# Altium schematic sheet Connector_Sheet.SchDoc
size A4; DocumentNumber: 5; SheetNumber: 5; SheetTotal: 7
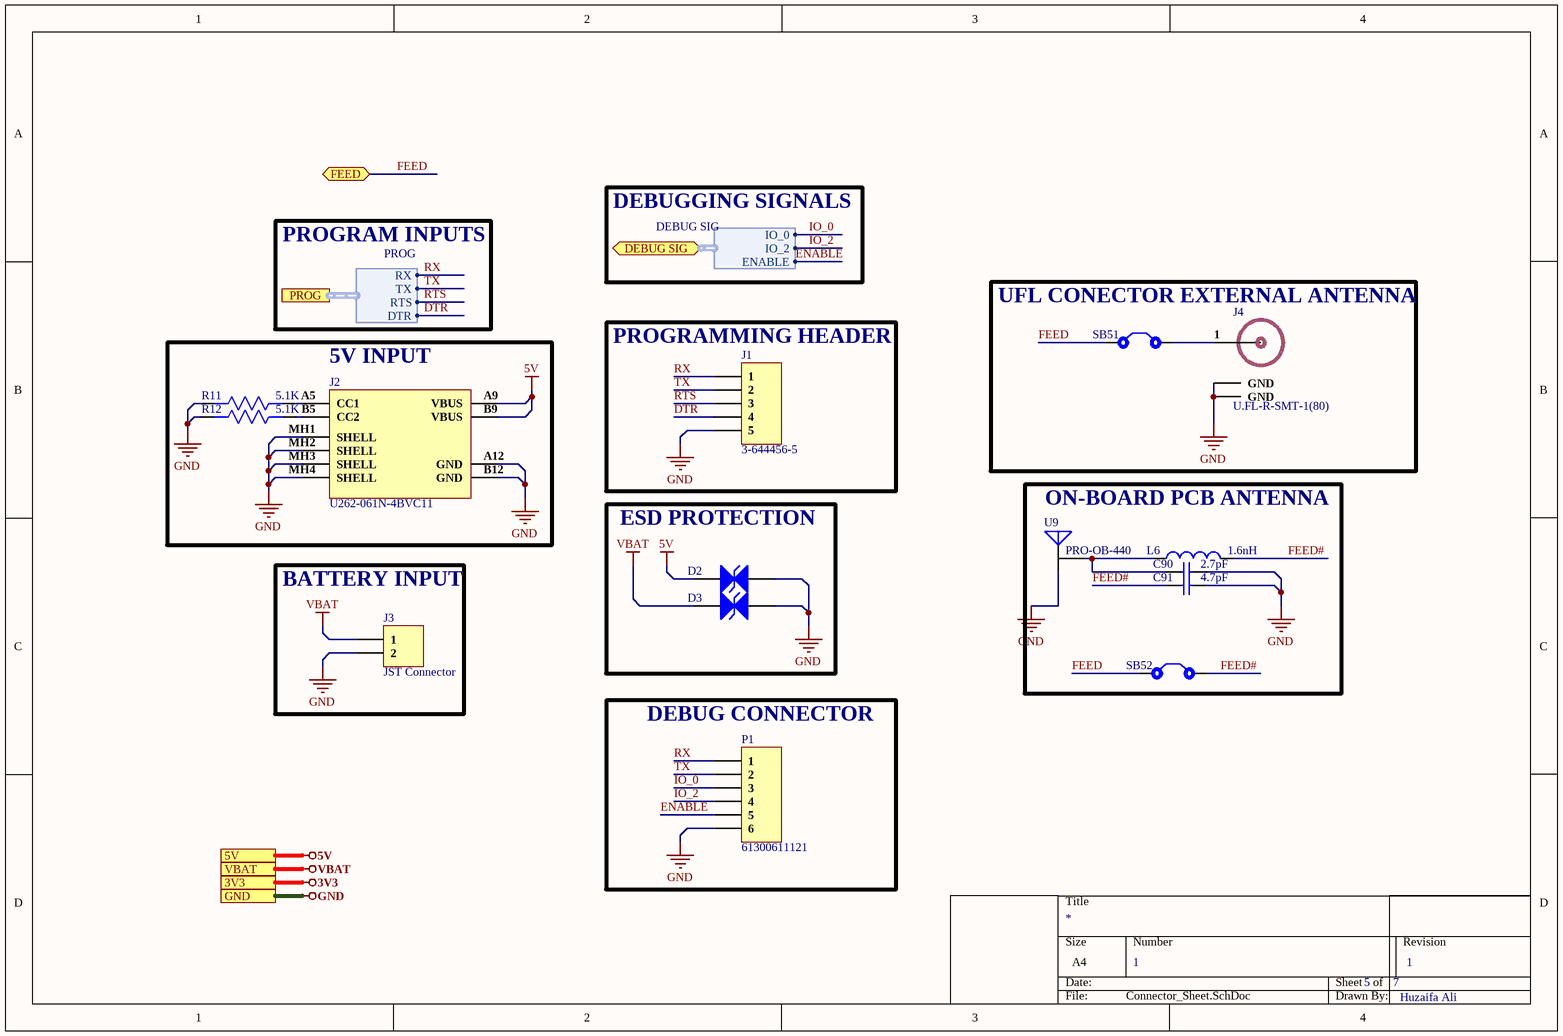
[diagram p0: Connector_Sheet.SchDoc]

## Parts
C90  2.7pF  [Cap 0603]
C91  4.7pF  [Cap 0603]
D2  TPD1E10B06DPYR  [X1SON - 0.45 mm max height]  (value not drawn)
D3  TPD1E10B06DPYR  [X1SON - 0.45 mm max height]  (value not drawn)
J1  3-644456-5  [HDR1X5]
J2  U262-061N-4BVC11  [U262-061N-4BVC11]
J3  JST Connector  [JST Connector]
J4  U.FL-R-SMT-1(80)  [U.FL-R-SMT-1(80)]
L6  1.6nH  [FHW0603UC1N6KST]
P1  61300611121  [HDR1X6]
R11  5.1K  [Res0603]
R12  5.1K  [Res0603]
SB51  Solder Bridge  [Solder Bridge]  (value not drawn)
SB52  Solder Bridge  [Solder Bridge]  (value not drawn)
U9  PRO-OB-440  [PRO-OB-440]

## Blocks framed on the sheet
UFL CONECTOR EXTERNAL ANTENNA: J4 SB51
5V INPUT: J2 R11 R12
PROGRAMMING HEADER: J1
ESD PROTECTION: D2 D3
ON-BOARD PCB ANTENNA: C90 C91 L6 SB52 U9
BATTERY INPUT: J3
DEBUG CONNECTOR: P1

## Ports
3V3, 5V, DEBUG SIG (bidir, harness DEBUG SIG), FEED (bidir), GND, PROG (harness PROG), VBAT

## Harnesses
PROG: RX, TX, RTS, DTR
DEBUG SIG: IO_0, IO_2, ENABLE

## Nets
3V3: port 3V3
5V: D2.2 J2.A9(VBUS) J2.B9(VBUS) ; port 5V
GND: C90.2 C91.2 D2.1 D3.1 J1.5 J2.A12(GND) J2.B12(GND) J2.MH1(SHELL) J2.MH2(SHELL) J2.MH3(SHELL) J2.MH4(SHELL) J3.2 J4.2(GND) J4.3(GND) P1.6 R11.2 R12.2 U9.1(A) ; port GND
VBAT: D3.2 J3.1 ; port VBAT
DTR: J1.4 ; port PROG.DTR
ENABLE: P1.5 ; port DEBUG SIG.ENABLE
FEED: SB51.1 SB52.1 ; port FEED
FEED#: C91.1 L6.2 SB52.2
IO_0: P1.3 ; port DEBUG SIG.IO_0
IO_2: P1.4 ; port DEBUG SIG.IO_2
RTS: J1.3 ; port PROG.RTS
RX: J1.1 P1.1 ; port PROG.RX
TX: J1.2 P1.2 ; port PROG.TX
NetC90_1: C90.1 L6.1 U9.2(A)
NetJ2_A5: J2.A5(CC1) R11.1
NetJ2_B5: J2.B5(CC2) R12.1
NetJ4_1: J4.1(RF_IN) SB51.2

Not connected (* = marked no-connect by the designer): U9 3(A) 4(A)

## Notes on the sheet
- PROGRAM INPUTS
- DEBUGGING SIGNALS
- 1
- Huzaifa Ali

## Library data of the parts
C90 = CC0603CRNPO9BN2R7: CAP SMD  2.7pF ±0.25pF 50V NPO 0603; Manufacturer: Yageo; Dielectric: C0G; Insulation Resistance: 10GR; Supplier 1: Newark; Manufacturer Part Number: CC0603CRNPO9BN2R7; RoHS: Yes; Category: Ceramic Capacitors; Stock 1: 2084; Pricing 1: 1=0.10000, 10=0.05800, 25=0.04700, 50=0.03700, 100=0.02600 (USD); Mount: Surface Mount; Case/Package: 0603; Case Code (Imperial): 0603; Case Code (Metric): 1608; Weight: 7.1E-05oz; Min Operating Temperature: -55°C; Max Operating Temperature: 125°C; Capacitance: 2.7pF; Packaging: Tape and Reel; Voltage Rating: 50V; Voltage Rating (DC): 50V; Termination: SMD/SMT; Resistor Type: Ceramic; Voltage: 50V; Series: CC; Length: 1.6mm; Width: 0.8mm; Height: 0.8mm; Thickness: 0.035inch; Depth: 0.8mm; RoHS Compliant: Yes; REACH SVHC: Unknown; Lead Free: Lead Free; ComponentLink1URL: https://datasheet.ciiva.com/11786/0900766b8079c870-11786434.pdf?src-supplier=RSComponents; ComponentLink1Description: https://datasheet.ciiva.com/11786/0900766b8079c870-11786434.pdf?src-supplier=RSComponents; ComponentLink2URL: https://datasheet.ciiva.com/13265/upy-gp-np0-16v-to-50v-8-3714-13265174.pdf?src-supplier=Mouser; ComponentLink2Description: https://datasheet.ciiva.com/13265/upy-gp-np0-16v-to-50v-8-3714-13265174.pdf?src-supplier=Mouser; ComponentLink3URL: https://datasheet.ciiva.com/8033/1443161-8033693.pdf?src-supplier=Element14; ComponentLink3Description: https://datasheet.ciiva.com/8033/1443161-8033693.pdf?src-supplier=Element14; ComponentLink4URL: https://datasheet.ciiva.com/11586/upy-gp-np0-16v-to-50v-8-11586442.pdf?src-supplier=Avnet; ComponentLink4Description: https://datasheet.ciiva.com/11586/upy-gp-np0-16v-to-50v-8-11586442.pdf?src-supplier=Avnet; Supplier Part Number 1: 46WX090
C91 = CC0603BRNPO9BN4R7: CAP SMD 4.7pF ±0.1pF 50V NPO 0603; Manufacturer: Yageo; Dielectric: C0G; Tolerance: 5%; Supplier 1: Newark; Manufacturer Part Number: CC0603BRNPO9BN4R7; RoHS: Yes; Category: Ceramic Capacitors; Stock 1: 108000; Pricing 1: 1=0.02700, 4000=0.02300, 8000=0.01900, 16000=0.01400 (USD); Mount: Surface Mount; Case/Package: 0603; Case Code (Imperial): 0603; Case Code (Metric): 1608; Min Operating Temperature: -55°C; Max Operating Temperature: 125°C; Capacitance: 4.7pF; Package Quantity: 4000; Voltage Rating: 50V; Voltage Rating (DC): 50V; Packaging: Tape and Reel; Termination: SMD/SMT; Resistor Type: Ceramic; Voltage: 50V; Series: CC; Length: 1.6mm; Width: 0.8mm; Height: 0.8mm; Thickness: 0.035inch; Depth: 0.8mm; Radiation Hardening: No; Lead Free: Lead Free; RoHS Compliant: Yes; ComponentLink1URL: http://www.mouser.com/ds/2/447/Yageo_UPY-GP_NP0_16V-to-50V_9-358835.pdf?src-supplier=Mouser; ComponentLink1Description: http://www.mouser.com/ds/2/447/Yageo_UPY-GP_NP0_16V-to-50V_9-358835.pdf?src-supplier=Mouser; ComponentLink2URL: https://www.verical.com/server-webapp/html/getDatasheet?partID=403493&src-supplier=Verical; ComponentLink2Description: https://www.verical.com/server-webapp/html/getDatasheet?partID=403493&src-supplier=Verical; ComponentLink3URL: http://www.yageo.com/documents/recent/UPY-GP_NP0_16V-to-50V_16.pdf?src-supplier=Digi-Key; ComponentLink3Description: http://www.yageo.com/documents/recent/UPY-GP_NP0_16V-to-50V_16.pdf?src-supplier=Digi-Key; ComponentLink4URL: https://www.yageo.com/upload/media/product/productsearch/datasheet/mlcc/UPY-GP_NP0_16V-to-50V_18.pdf?src-supplier=Digi-Key; ComponentLink4Description: https://www.yageo.com/upload/media/product/productsearch/datasheet/mlcc/UPY-GP_NP0_16V-to-50V_18.pdf?src-supplier=Digi-Key; ComponentLink5URL: http://www.yageo.com/documents/recent/UPY-GP_NP0_16V-to-50V_6.pdf?src-supplier=Avnet; ComponentLink5Description: http://www.yageo.com/documents/recent/UPY-GP_NP0_16V-to-50V_6.pdf?src-supplier=Avnet; ComponentLink6URL: http://www.yageo.com/documents/recent/UPY-GP_NP0_16V-to-50V_9.pdf?src-supplier=Future+Electronics; ComponentLink6Description: http://www.yageo.com/documents/recent/UPY-GP_NP0_16V-to-50V_9.pdf?src-supplier=Future+Electronics; ComponentLink7URL: http://www.yageo.com/exep/pages/download/literatures/ProductSelectionGuide%202014_Final_2.pdf?src-supplier=Digi-Key; ComponentLink7Description: http://www.yageo.com/exep/pages/download/literatures/ProductSelectionGuide%202014_Final_2.pdf?src-supplier=Digi-Key; Supplier Part Number 1: 50AJ2583
D2 D3 = TPD1E10B06DPYR: DIODE TVS SMD 5.5V 5A 90W; Manufacturer: Texas Instruments; Capacitance: 12pF; Direction: Bidirectional; Breakdown Voltage: 6V; Number of Channels: 1; Clamping Voltage: 14V; Power Line Protection: No; Leakage Current: 100nA; ESD Protection: Yes; Test Current: 1mA; Element Configuration: Single; Interface: GPIO; Diode Type: ZENER; Supplier 1: Mouser; Manufacturer Part Number: TPD1E10B06DPYR; RoHS: Yes; Category: TVS Diodes; Pricing 1: 1=0.39000, 10=0.29800, 50=0.29800, 100=0.18600, 500=0.12700, 1000=0.09800, 2500=0.08300, 10000=0.07500 (USD); Case/Package: SON; Number of Pins: 2; Contact Plating: Gold; Min Operating Temperature: -40°C; Max Operating Temperature: 125°C; Package Quantity: 1; Packaging: Tape and Reel; Number of Bidirectional Channels: 1; Reverse Standoff Voltage: 5.5V; Min Breakdown Voltage: 6V; Peak Pulse Power: 90W; Working Voltage: 5.5V; Max Reverse Leakage Current: 100nA; Peak Pulse Current: 5A; Resistor Type: Zener; Series: -; Length: 1.1mm; Width: 0.7mm; Height: 0.35mm; Radiation Hardening: No; REACH SVHC: No SVHC; Lead Free: Lead Free; RoHS Compliant: Yes; ComponentLink1URL: https://datasheet.ciiva.com/22691/1877100-22691786.pdf?src-supplier=Element14; ComponentLink1Description: https://datasheet.ciiva.com/22691/1877100-22691786.pdf?src-supplier=Element14; ComponentLink2URL: https://datasheet.ciiva.com/46384/1877100-46384054.pdf?src-supplier=Element14; ComponentLink2Description: https://datasheet.ciiva.com/46384/1877100-46384054.pdf?src-supplier=Element14; ComponentLink3URL: https://datasheet.ciiva.com/2961/tpd1e10b06-2961245.pdf?src-supplier=Digi-Key; ComponentLink3Description: https://datasheet.ciiva.com/2961/tpd1e10b06-2961245.pdf?src-supplier=Digi-Key; ComponentLink4URL: https://datasheet.ciiva.com/6574/tpd1e10b06-6574654.pdf?src-supplier=Digi-Key; ComponentLink4Description: https://datasheet.ciiva.com/6574/tpd1e10b06-6574654.pdf?src-supplier=Digi-Key; ComponentLink5URL: https://datasheet.ciiva.com/2961/tpd1e10b06-2961246.pdf?src-supplier=Digi-Key; ComponentLink5Description: https://datasheet.ciiva.com/2961/tpd1e10b06-2961246.pdf?src-supplier=Digi-Key; ComponentLink6URL: https://datasheet.ciiva.com/14195/tpd1e10b06-14195178.pdf?src-supplier=Avnet; ComponentLink6Description: https://datasheet.ciiva.com/14195/tpd1e10b06-14195178.pdf?src-supplier=Avnet; Supplier Part Number 1: 595-TPD1E10B06DPYR
J1 = 3-644456-5: 05P MTA100 HDR ASSY (NARROW); Manufacturer: TE Connectivity; Underplate Material: Nickel; Number of Positions: 5; Connector Type: Plug,Header,Pin; Mating Alignment: No (Without); PCB Mount Retention: Without; Max Voltage Rating (AC): 250V; Connector System: Wire-to-Board; Contact Current Rating: 5A; Contact Resistance: 6mR; Gender: Male; PCB Mounting Orientation: Vertical; Contact Style: Straight; Pitch: 2.54mm; Plating Thickness: 1.27um; PCB Thickness: 0.063inch; Tail Length: 0.11inch; Approvals: CSA; Supplier 1: Digi-Key; Manufacturer Part Number: 3-644456-5; RoHS: Yes; Category: Connectors; Stock 1: 30835; Pricing 1: 1=0.45000, 10=0.39200, 100=0.32330, 500=0.28114, 1000=0.23195, 5000=0.20383, 10000=0.18978 (USD); Mount: Through Hole; Color: Natural; Housing Material: Polyester; Housing Color: Natural; Contact Plating: Tin,Matte; Contact Material: Copper Alloy; Contact Shape: Square; Insulation Material: Thermoplastic; Insulation Color: Natural; Contact Finish - Mating: TIN; Min Operating Temperature: -67°C; Max Operating Temperature: 221°C; Number of Rows: 1; Packaging: Bag; Package Quantity: 500; Contact Gender: Male; Termination: Solder; Orientation: Straight; Number of Contacts: 5; Strain Relief: No (Without); Contact Retention: No (Without); Mating Retention: No (Without); PCB Mount Alignment: No (Without); Sealable: No (Without); Shrouded: No (Without); Voltage Rating: 250V; Voltage Rating (AC): 250V; Current Rating: 5A; Backwall/Post Interruptions: No (Without); Series: MTA-100; Contact Type: Male Pin; Length: 12.4mm; Height: 10.03mm; Contact Mating Length: 7.49mm; Depth: 2.33mm; Radiation Hardening: No; Flammability Rating: UL94 V-0; ELV: Compliant; Lead Free: Lead Free; REACH SVHC: Unknown; ComponentLink1URL: https://datasheet.ciiva.com/16307/3-644456-5-16307486.pdf?src-supplier=Future+Electronics; ComponentLink1Description: https://datasheet.ciiva.com/16307/3-644456-5-16307486.pdf?src-supplier=Future+Electronics; ComponentLink2URL: https://datasheet.ciiva.com/3118/eng-ds-82056-mta-0608-3118213.pdf?src-supplier=Avnet; ComponentLink2Description: https://datasheet.ciiva.com/3118/eng-ds-82056-mta-0608-3118213.pdf?src-supplier=Avnet; ComponentLink3URL: https://datasheet.ciiva.com/30250/8852eng-ds-82056-mta-0608-30250984.pdf?src-supplier=Onlinecomponents.com; ComponentLink3Description: https://datasheet.ciiva.com/30250/8852eng-ds-82056-mta-0608-30250984.pdf?src-supplier=Onlinecomponents.com; ComponentLink4URL: https://datasheet.ciiva.com/14641/70087179-14641766.pdf?src-supplier=Allied+Electronics; ComponentLink4Description: https://datasheet.ciiva.com/14641/70087179-14641766.pdf?src-supplier=Allied+Electronics; ComponentLink5URL: https://datasheet.ciiva.com/709/eng-cd-644456-d2-709724.pdf?src-supplier=Digi-Key; ComponentLink5Description: https://datasheet.ciiva.com/709/eng-cd-644456-d2-709724.pdf?src-supplier=Digi-Key; Supplier Part Number 1: A31115-ND
J2 = U262-061N-4BVC11: USB 3.1 1 Surface Mount 6 Female -25℃~+85℃ Type-C SMD USB Connectors ROHS; Manufacturer: XKB; Manufacturer Part Number: U262-061N-4BVC11; Footprint: Custom; ComponentLink1Description: LCSC; ComponentLink1URL: https://www.lcsc.com/product-detail/span-style-background-color-ff0-USB-span-Connectors_XKB-Connectivity-U262-061N-4BVC11_C2764612.html
J3 = 2 Pin JST Connector
J4 = U.FL-R-SMT-1(80): CONN U.FL RCPT STR 50 OHM SMD; Manufacturer: Hirose; Supplier 1: Future Electronics; Manufacturer Part Number: U.FL-R-SMT-1(80); Stock 1: 1272; Pricing 1: 1=1.07, 500=0.785, 1500=0.74, 2500=0.72, 5000=0.695 (USD); Case/Package: SMD/SMT; Package Quantity: 10000; Packaging: Tape and Reel; Lead Free: Lead Free; ComponentLink1URL: https://www.hirose.com/product/en/download_file/key_name/U.FL-R-SMT-1%2880%29/category/Specification%20Sheet/doc_file_id/37638/?file_category_id=9&item_id=03310472280&is_series=&src-supplier=Digi-Key; ComponentLink1Description: https://www.hirose.com/product/en/download_file/key_name/U.FL-R-SMT-1%2880%29/category/Specification%20Sheet/doc_file_id/37638/?file_category_id=9&item_id=03310472280&is_series=&src-supplier=Digi-Key; ComponentLink2URL: http://www.mouser.com/ds/2/185/U.FL_catalog-939761.pdf?src-supplier=Mouser; ComponentLink2Description: http://www.mouser.com/ds/2/185/U.FL_catalog-939761.pdf?src-supplier=Mouser; Supplier Part Number 1: U.FL-R-SMT-1(80)-CUTT
L6 = FHW0603UC1N6KST: IND 700mA 1.6nH ±10% 40mΩ 0603
P1 = e-50004: CONN HEADER VERT 6POS 2.54MM; Manufacturer: Wurth Electronics; Current Rating: 3A; Voltage Rating: 250V; Number of Positions: 6; Gender: Male; Connector Type: Male Pin; Pitch: 0.1inch; Supplier 1: Digi-Key; Manufacturer Part Number: 61300611121; Stock 1: 14573; Pricing 1: 1=0.33, 10=0.279, 25=0.232, 50=0.194, 100=0.176, 1000=0.16 (USD); Mount: Through Hole; Contact Plating: Gold; Contact Material: Copper Alloy,Copper; Housing Material: PBT; Color: Black; Min Operating Temperature: -40°C; Max Operating Temperature: 125°C; Number of Rows: 1; Contact Gender: Male; Packaging: Bulk; Termination: Through Hole; Number of Contacts: 6; Contact Mating Length: 0.236inch; REACH SVHC: Unknown; Lead Free: Lead Free; ComponentLink1URL: http://www.farnell.com/cad/1737268.pdf?src-supplier=Element14; ComponentLink1Description: http://www.farnell.com/cad/1737268.pdf?src-supplier=Element14; ComponentLink2URL: https://katalog.we-online.de/em/datasheet/6130xx11121.pdf?src-supplier=Digi-Key; ComponentLink2Description: https://katalog.we-online.de/em/datasheet/6130xx11121.pdf?src-supplier=Digi-Key; ComponentLink3URL: http://www.mouser.com/ds/2/445/6130xx11121-538006.pdf?src-supplier=Mouser; ComponentLink3Description: http://www.mouser.com/ds/2/445/6130xx11121-538006.pdf?src-supplier=Mouser; Supplier Part Number 1: 732-5319-ND
R11 R12 = RC0603JR-075K1L: RES SMD 5.1K OHM 5% 1/10W 0603; Manufacturer: Yageo; Resistance: 5.1kR; Power Rating: 100mW; Voltage Rating: 50V; Temperature Coefficient: 100ppm/°C; Supplier 1: Digi-Key; Manufacturer Part Number: RC0603JR-075K1L; RoHS: Yes; Category: Chip SMD Resistors; Stock 1: 245818; Pricing 1: 1=0.10000, 10=0.02000, 100=0.00800, 1000=0.00360, 2500=0.00312 (USD); Case/Package: 0603; Number of Pins: 2; Case Code (Imperial): 0603; Case Code (Metric): 1608; Size Code: 0603; Min Operating Temperature: -55°C; Max Operating Temperature: 155°C; Tolerance: 5%; Packaging: Tape and Reel; Termination: SMD/SMT; Resistor Type: Thick Film; Voltage Rating (DC): 50V; Features: Moisture Resistant; Series: RC; Max Power Dissipation: 100mW; Number of Terminations: 2; Resistance Tolerance: 5%; Construction: Rectangular; Length: 1.6mm; Depth: 0.8mm; REACH SVHC: No SVHC; Military Standard: Not; Lead Free: Lead Free; RoHS Compliant: Yes; ComponentLink1URL: http://www.mouser.com/ds/2/447/RC0603-272842.pdf?src-supplier=Mouser; ComponentLink1Description: http://www.mouser.com/ds/2/447/RC0603-272842.pdf?src-supplier=Mouser; ComponentLink2URL: http://components.arrow.com/part/dataview/0323_00047491?src-supplier=Arrow+Europe; ComponentLink2Description: http://components.arrow.com/part/dataview/0323_00047491?src-supplier=Arrow+Europe; ComponentLink3URL: http://www.farnell.com/datasheets/2167052.pdf?src-supplier=Farnell; ComponentLink3Description: http://www.farnell.com/datasheets/2167052.pdf?src-supplier=Farnell; ComponentLink4URL: http://www.farnell.com/datasheets/2167052.pdf?src-supplier=Element14; ComponentLink4Description: http://www.farnell.com/datasheets/2167052.pdf?src-supplier=Element14; ComponentLink5URL: http://www.farnell.com/datasheets/2167052.pdf?src-supplier=Newark; ComponentLink5Description: http://www.farnell.com/datasheets/2167052.pdf?src-supplier=Newark; ComponentLink6URL: http://www.farnell.com/datasheets/1868787.pdf?src-supplier=Newark; ComponentLink6Description: http://www.farnell.com/datasheets/1868787.pdf?src-supplier=Newark; ComponentLink7URL: http://www.yageo.com/documents/recent/PYu-RC_Group_51_RoHS_L_10.pdf?src-supplier=Digi-Key; ComponentLink7Description: http://www.yageo.com/documents/recent/PYu-RC_Group_51_RoHS_L_10.pdf?src-supplier=Digi-Key; ComponentLink8URL: http://www.yageo.com/documents/recent/PYu-RC0603_51_RoHS_L_7.pdf?src-supplier=Future+Electronics; ComponentLink8Description: http://www.yageo.com/documents/recent/PYu-RC0603_51_RoHS_L_7.pdf?src-supplier=Future+Electronics; Supplier Part Number 1: 311-5.1KGRCT-ND
SB51 SB52 = Solder Bridge: Solder Bridge ON
U9 = PRO-OB-440: RF ANT 2.4GHZ STAMPED MET SLD; Manufacturer: Proant; Number of Bands: 1; Return Loss: -10dB; Supplier 1: Digi-Key; Manufacturer Part Number: PRO-OB-440; Stock 1: 23502; Pricing 1: 1=0.74, 10=0.647, 25=0.608, 100=0.4964, 250=0.46104, 500=0.39238 (USD); Mount: Surface Mount; Packaging: Cut Tape; Termination: Solder; ComponentLink1URL: https://media.digikey.com/pdf/Data%20Sheets/Proant%20PDF's/PRO-OB-440_Dwg.PDF?src-supplier=Digi-Key; ComponentLink1Description: https://media.digikey.com/pdf/Data%20Sheets/Proant%20PDF's/PRO-OB-440_Dwg.PDF?src-supplier=Digi-Key; ComponentLink2URL: http://www.proant.se/files/user/Application%20note%20-%20OnBoard%20SMD%20GNSS%20rev%202.0.pdf?src-supplier=Digi-Key; ComponentLink2Description: http://www.proant.se/files/user/Application%20note%20-%20OnBoard%20SMD%20GNSS%20rev%202.0.pdf?src-supplier=Digi-Key; ComponentLink3URL: http://www.proant.se/files/user/Documents/Datasheet%20-%20OnBoard%20SMD%202400%20MHz%20rev%203.pdf?src-supplier=Digi-Key; ComponentLink3Description: http://www.proant.se/files/user/Documents/Datasheet%20-%20OnBoard%20SMD%202400%20MHz%20rev%203.pdf?src-supplier=Digi-Key; Supplier Part Number 1: 1532-1001-6-ND